# Altium schematic sheet PAGE03_I2C-GPIO.SchDoc
size 386 x 246 mm
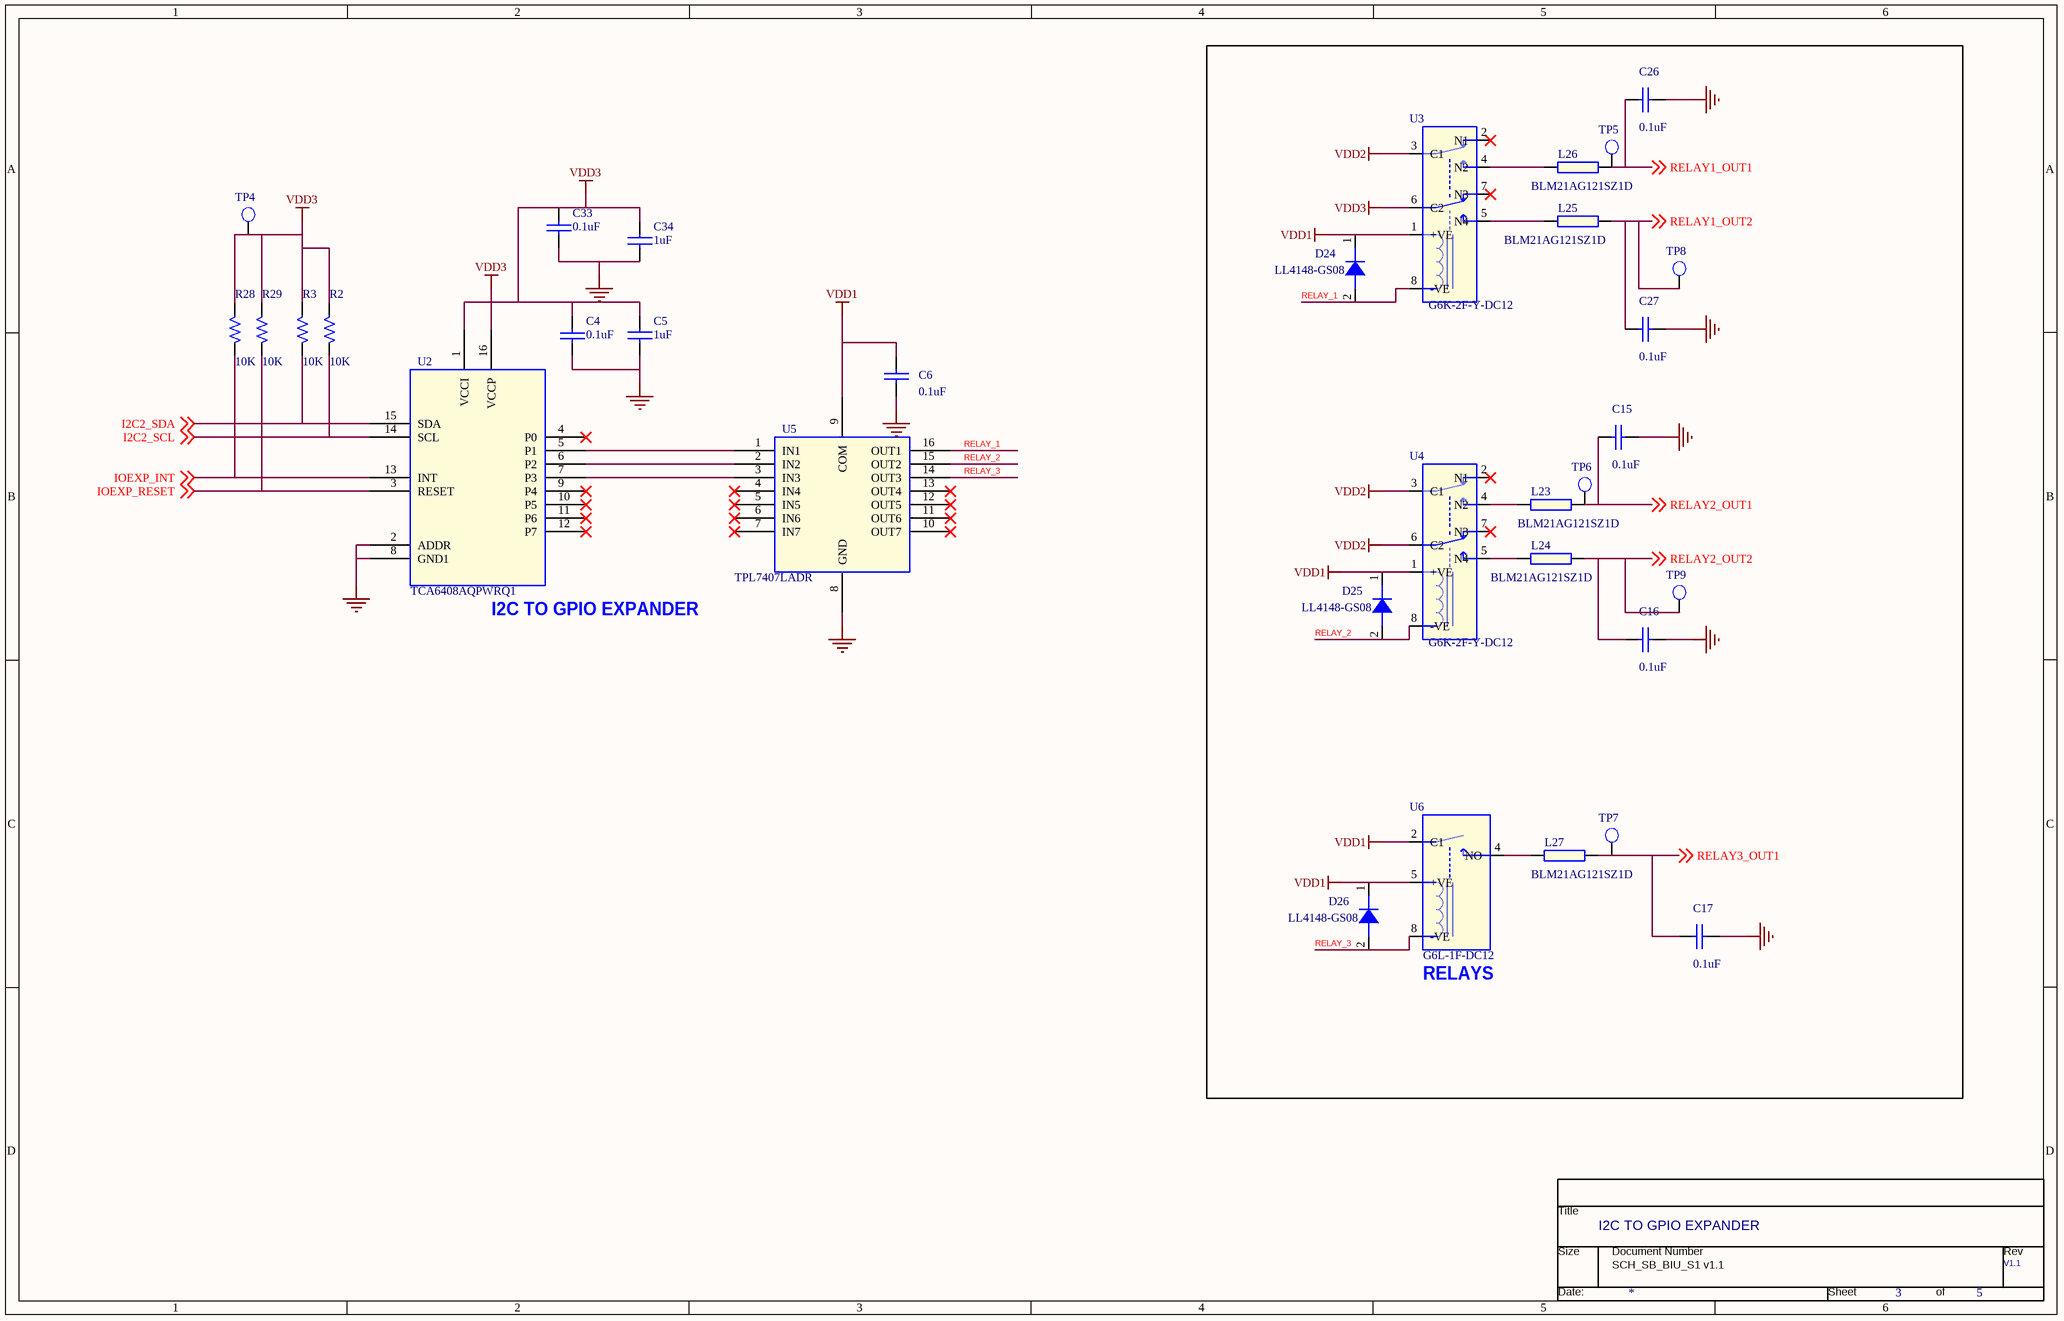
[diagram p0: PAGE03_I2C-GPIO.SchDoc]

## Parts
*  Page Count: 5  Page Number: 3  Title: I2C TO GPIO EXPANDER  RevCode: V1.1  (hidden comment: TitleBlock0)  (graphical)
C4  0.1uF  [CAPC1005X55N_A]
C5  1uF  [CAPC1608X90N_A]
C6  0.1uF  [CAPC1608X90N]
C15  0.1uF  [CAPC1608X90N]
C16  0.1uF  [CAPC1608X90N]
C17  0.1uF  [CAPC1608X90N]
C26  0.1uF  [CAPC1608X90N]
C27  0.1uF  [CAPC1608X90N]
C33  0.1uF  [CAPC1005X55N_A]
C34  1uF  [CAPC1608X90N_A]
D24  LL4148-GS08  [DIOMELF3515N]
D25  LL4148-GS08  [DIOMELF3515N]
D26  LL4148-GS08  [DIOMELF3515N]
L23  BLM21AG121SZ1D  [INDC1608X95N]
L24  BLM21AG121SZ1D  [INDC1608X95N]
L25  BLM21AG121SZ1D  [INDC1608X95N]
L26  BLM21AG121SZ1D  [INDC1608X95N]
L27  BLM21AG121SZ1D  [INDC1608X95N]
R2  10K  [AX/RC05]
R3  10K  [AX/RC05]
R28  10K  [AX/RC05]
R29  10K  [AX/RC05]
TP4  T POINT R  [TPC160H100]  (value not drawn)
TP5  T POINT R  [TPC160H100]  (value not drawn)
TP6  T POINT R  [TPC160H100]  (value not drawn)
TP7  T POINT R  [TPC160H100]  (value not drawn)
TP8  T POINT R  [TPC160H100]  (value not drawn)
TP9  T POINT R  [TPC160H100]  (value not drawn)
U2  TCA6408AQPWRQ1  [TSSOP65P640X120-16N_B]
U3  G6K-2F-Y-DC12  [RELAY_G6K-2F-Y-DC12]
U4  G6K-2F-Y-DC12  [RELAY_G6K-2F-Y-DC12]
U5  TPL7407LADR  [SOIC127P600X175-16N_TI]
U6  G6L-1F-DC12  [RELAY_G6L-1F-DC12]

## Blocks framed on the sheet
RELAYS: C15-C17 C26 C27 D24-D26 L23-L27 TP5-TP9 U3 U4 U6

## Nets
GND: C4.2 C5.2 C6.1 C15.1 C16.1 C17.1 C26.1 C27.1 C33.2 C34.2 U2.2(ADDR) U2.8(GND1) U5.8(GND)
VDD1: C6.2 D24.1(K) D25.1(K) D26.1(K) U3.1(+VE) U4.1(+VE) U5.9(COM) U6.2(C1) U6.5(+VE)
VDD2: U3.3(C1) U4.3(C1) U4.6(C2)
VDD3: C4.1 C5.1 C33.1 C34.1 R2.1 R3.1 R28.1 R29.1 TP4.1(TP) U2.1(VCCI) U2.16(VCCP) U3.6(C2)
I2C2_SCL: R2.2 U2.14(SCL) ; off-sheet I2C2_SCL
I2C2_SDA: R3.2 U2.15(SDA) ; off-sheet I2C2_SDA
IOEXP_INT: R28.2 U2.13(INT) ; off-sheet IOEXP_INT
IOEXP_RESET: R29.2 U2.3(RESET) ; off-sheet IOEXP_RESET
RELAY1_OUT1: C26.2 L26.2 TP5.1(TP) ; off-sheet RELAY1_OUT1
RELAY1_OUT2: C27.2 L25.2 TP8.1(TP) ; off-sheet RELAY1_OUT2
RELAY2_OUT1: C15.2 L23.2 TP6.1(TP) ; off-sheet RELAY2_OUT1
RELAY2_OUT2: C16.2 L24.2 TP9.1(TP) ; off-sheet RELAY2_OUT2
RELAY3_OUT1: C17.2 L27.2 TP7.1(TP) ; off-sheet RELAY3_OUT1
RELAY_1: D24.2(A) U3.8(-VE) U5.16(OUT1)
RELAY_2: D25.2(A) U4.8(-VE) U5.15(OUT2)
RELAY_3: D26.2(A) U5.14(OUT3) U6.8(-VE)
NetL23_1: L23.1 U4.4(N2)
NetL24_1: L24.1 U4.5(N4)
NetL25_1: L25.1 U3.5(N4)
NetL26_1: L26.1 U3.4(N2)
NetL27_1: L27.1 U6.4(NO)
NetU2_5: U2.5(P1) U5.1(IN1)
NetU2_6: U2.6(P2) U5.2(IN2)
NetU2_7: U2.7(P3) U5.3(IN3)

Not connected (* = marked no-connect by the designer): U2 4(P0)* 9(P4)* 10(P5)* 11(P6)* 12(P7)*; U3 2(N1)* 7(N3)*; U4 2(N1)* 7(N3)*; U5 4(IN4)* 5(IN5)* 6(IN6)* 7(IN7)* 10(OUT7)* 11(OUT6)* 12(OUT5)* 13(OUT4)*

## Notes on the sheet
- (near U2) I2C TO GPIO EXPANDER
- SCH_SB_BIU_S1 v1.1
- (in symbol TitleBlock0) Title; Size; Document Number; Rev; Date:; Sheet; of

## Library data of the parts
* = TitleBlock0: Page Size: A; Page Create Date: March  8, 1995; Page Modify Date: *
C4 C33 = CAP_NP_78: CAP CER 0.1uF 16V 10% X7R 0402; Manufacturere's P/N: GRM155R71C104KA88J; Manufacturer: MURATA; CLASS: DISCRETE; FPLIST: CC0402_25,CC0402_HD,0402_CC; CAD_APPROVED: Yes; AGILE_PN: 150-75182; SIGNAL_MODEL: DEFAULT_CAPACITOR_100000pF_2_1; PCB Footprint: CAPC1005X55N_A; TOL: 10%; HEIGHT: 0.635MM; ROHS: Yes; Tolerance: 10%; WVDC: 16V; Package: 0402
C5 C34 = CAP NP: CAP CER 1uF 25V 10% X7R 0603; Manufacturere's P/N: CGA3E1X7R1E105K080AC; Manufacturer: TDK; PCB Footprint: CAPC1608X90N_A; Package: 0603
C6 C15-C17 = CAP_NP_78: CAP CER 0.1UF 50V X7R 0603; Manufacturere's P/N: GRM188R71H104KA93D; Manufacturer: MURATA; CLASS: DISCRETE; CAD_APPROVED: Yes; Tolerance: ±10%; AGILE_PN: 150-75182; SIGNAL_MODEL: DEFAULT_CAPACITOR_100000pF_2_1; PCB Footprint: CAPC1608X90N; WVDC: 50V; HEIGHT: 0.635MM; ROHS: Yes; Package: 0603
C26 C27 = CAP_NP_78: CAP CER 0.1UF 50V X7R 0603; Manufacturer: MURATA; Manufacturere's P/N: GRM188R71H104KA93D; CLASS: DISCRETE; SIGNAL_MODEL: DEFAULT_CAPACITOR_100000pF_2_1; AGILE_PN: 150-75182; Tolerance: ±10%; CAD_APPROVED: Yes; PCB Footprint: CAPC1608X90N; Package: 0603; ROHS: Yes; HEIGHT: 0.635MM; WVDC: 50V
D24-D26 = DIODE PIN_1: DIODE GEN PURP 75V 300MA SOD80; Manufacturer: Vishay Semiconductor; PCB Footprint: DIOMELF3515N; Manufacturer Part Number: LL4148-GS08; Package: SOD-80; Manufacturere's P/N: LL4148-GS08
L23-L27 = L-33R100MHz-3A-25%-0603: Ferrite Beads 0805 120ohms 1000mA Auto Infotainment; Manufacturer: Murata Electronics; Tolerance: 25%; Rating: 3A; PCB Footprint: INDC2012X105N; User_Value: BLM21AG121SZ1D; Package: 0805; Manufacturer Part Number: BLM21AG121SZ1D; Manufacturere's P/N: BLM21AG121SZ1D
R2 R29 = R_0: RES SMD 10K OHM 1% 1/10W 0603; Manufacturere's P/N: RCA060310K0FKEA; Manufacturer: Vishay Dale; TC2: 0; POWER: RMAX; MAX_TEMP: RTMAX; SLOPE: RSMAX; VOLTAGE: RVMAX; PSpiceTemplate: R^@REFDES %1 %2 ?TOLERANCE|R^@REFDES| @VALUE TC=@TC1,@TC2 ?TOLERANCE|\n.model R^@REFDES RES R=1 DEV=@TOLERANCE%|; DIST: FLAT; PCB Footprint: RESC1608X55N_B; TC1: 0; TOLERANCE: 1%; Package: 0603; Manufacturer Part Number: RCA060310K0FKEA; Value: 10K
R3 R28 = R_0: RES SMD 10K OHM 1% 1/10W 0603; Manufacturer: Vishay Dale; Manufacturere's P/N: RCA060310K0FKEA; TC2: 0; POWER: RMAX; MAX_TEMP: RTMAX; SLOPE: RSMAX; VOLTAGE: RVMAX; PSpiceTemplate: R^@REFDES %1 %2 ?TOLERANCE|R^@REFDES| @VALUE TC=@TC1,@TC2 ?TOLERANCE|\n.model R^@REFDES RES R=1 DEV=@TOLERANCE%|; DIST: FLAT; PCB Footprint: RESC1608X55N_B; TC1: 0; TOLERANCE: 1%; Package: 0603; Manufacturer Part Number: RCA060310K0FKEA; Value: 10K
U2 = TCA6408AQPWRQ1_1: Interface - I/O Expanders Automotive Low-Voltage 8-Bit I2C; Manufacturer: TI; PCB Footprint: TSSOP65P640X120-16N_B; Manufacturere's P/N: TCA6408AQPWRQ1; Package: TSSOP-16
U3 = Relay_DPDT_nb_0: Low Signal Relays - PCB Gullwing NoLatch 3.2 DPDT 12VDC 100mW; Manufacturer: Omron Electronics; PSpiceTemplate: X^@REFDES %A %B %NO1 %NC1 %COM1 %NO2 %NC2 %COM2 @MODEL PARAMS:\n+ T_make=@T_MAKE\n+ T_break=@T_BREAK\n+ I_pull=@I_PULL\n+ I_drop=@I_DROP\n+ R_coil=@R_COIL\n+ L_coil=@L_COIL\n+ R_open=@R_OPEN\n+ R_close=@R_CLOSE\n+Contact_match=@CONTACT_MATCH; CONTACT_MATCH: 0.95; R_CLOSE: .05; R_OPEN: 100MEG; L_COIL: 5mH; R_COIL: 100; I_DROP: 25ma; I_PULL: 35ma; T_BREAK: 10m; T_MAKE: 20m; PCB Footprint: RELAY_G6K-2F-Y-DC12; Manufacturere's P/N: G6K-2F-Y-DC12
U4 = Relay_DPDT_nb_0: Low Signal Relays - PCB Gullwing NoLatch 3.2 DPDT 12VDC 100mW; Manufacturer: Omron Electronics; PSpiceTemplate: X^@REFDES %A %B %NO1 %NC1 %COM1 %NO2 %NC2 %COM2 @MODEL PARAMS:\n+ T_make=@T_MAKE\n+ T_break=@T_BREAK\n+ I_pull=@I_PULL\n+ I_drop=@I_DROP\n+ R_coil=@R_COIL\n+ L_coil=@L_COIL\n+ R_open=@R_OPEN\n+ R_close=@R_CLOSE\n+Contact_match=@CONTACT_MATCH; CONTACT_MATCH: 0.95; R_CLOSE: .05; R_OPEN: 100MEG; L_COIL: 5mH; R_COIL: 100; I_DROP: 25ma; I_PULL: 35ma; T_BREAK: 10mSec; T_MAKE: 20mSec; PCB Footprint: RELAY_G6K-2F-Y-DC12; Manufacturere's P/N: G6K-2F-Y-DC12
U5 = TPL7407LADR_0: Gate Drivers 30-V, 7-Channel NMOS Array Low-Side Driver; Manufacturer: TI; PCB Footprint: SOIC127P600X175-16N_TI; Manufacturere's P/N: TPL7407LADR; Package: SOP-16
U6 = Relay_SPDT_b_0: Low Signal Relays - PCB LO PROF SPST 12VDC; Manufacturer: Omron Electronics; T_BOUNCE: 5mSec; T_MAKE: 20mSec; T_BREAK: 10mSec; I_PULL: 35ma; I_DROP: 25ma; R_COIL: 100; L_COIL: 5mH; R_OPEN: 100MEG; R_CLOSE: .05; PSpiceTemplate: X^@REFDES %A %B %NO %NC %COM @MODEL PARAMS:\n+ T_make=@T_MAKE\n+ T_break=@T_BREAK\n+ T_bounce=@T_BOUNCE\n+ I_pull=@I_PULL\n+ I_drop=@I_DROP\n+ R_coil=@R_COIL\n+ L_coil=@L_COIL\n+ R_open=@R_OPEN\n+ R_close=@R_CLOSE; PCB Footprint: RELAY_G6L-1F-DC12; Manufacturere's P/N: G6L-1F-DC12
TP4-TP9 = T POINT R: PCB Footprint: TPC160H100